# EAGLE design RS232 rev4 (EAGLE 7.3.0)
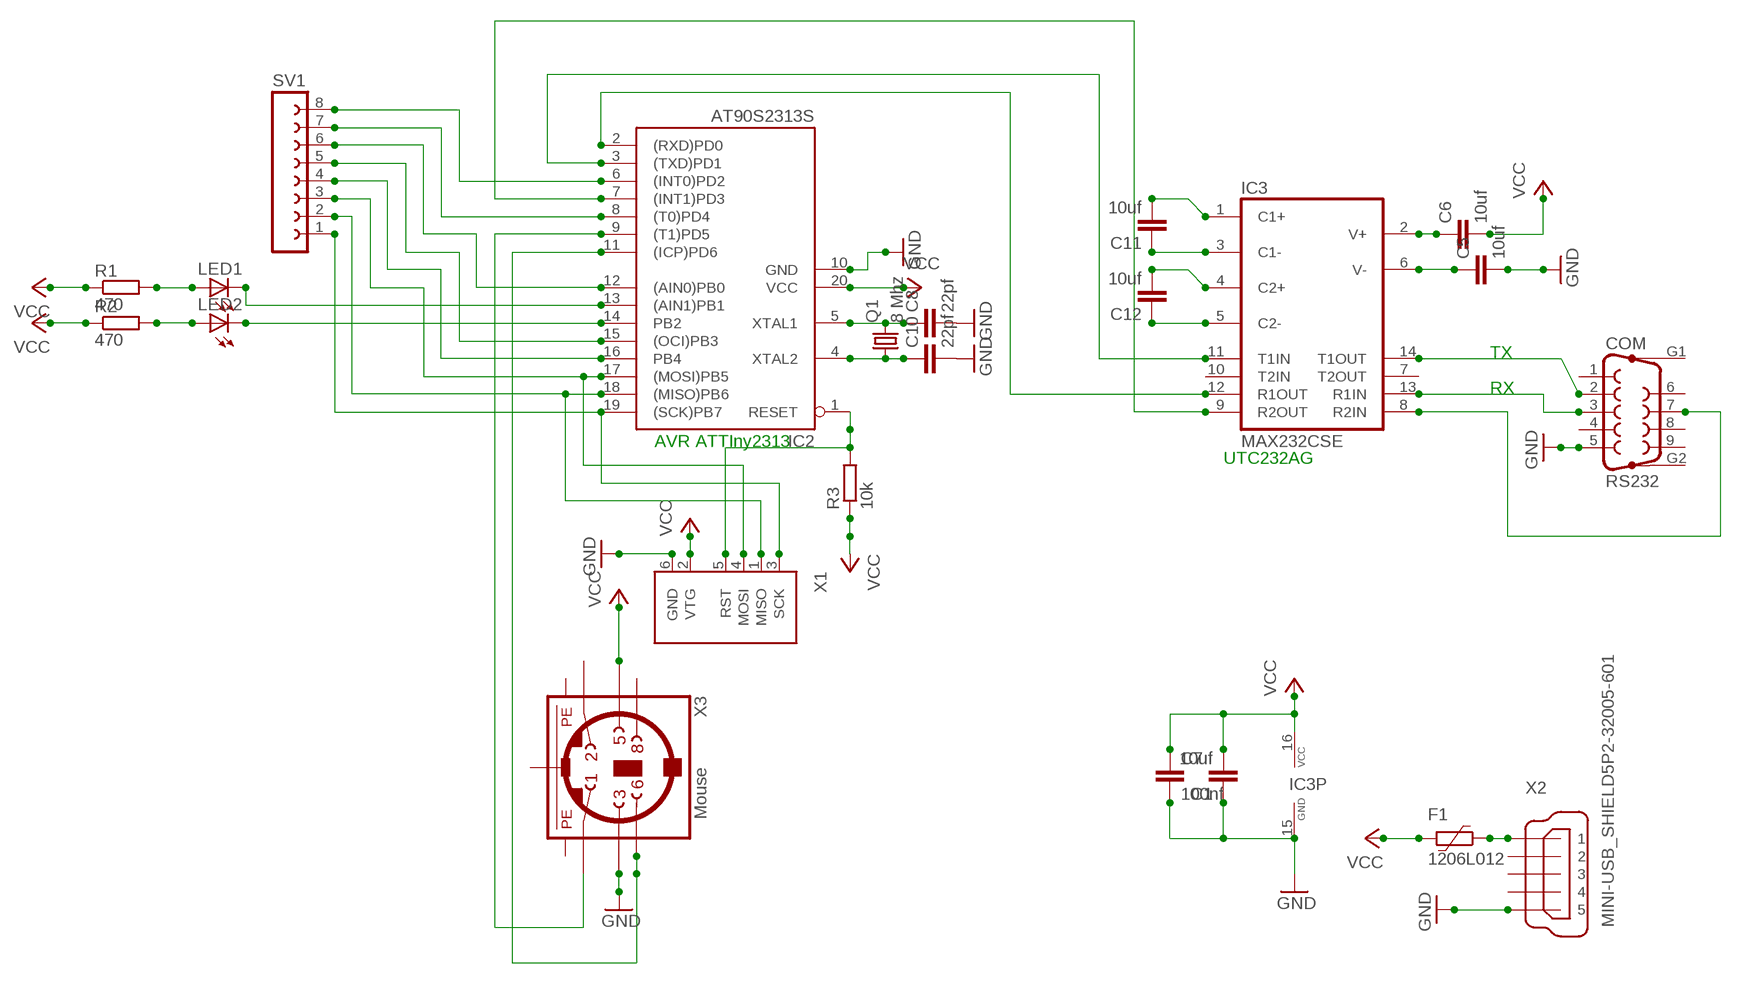
[diagram p0: schematic, sheet 1]

## Parts
C1  10uf  C-EUC1206K  [C1206K]
C5  10uf  C-EUC1206K  [C1206K]
C6  10uf  C-EUC1206K  [C1206K]
C7  100nf  C-EUC1206  [C1206]
C8  22pf  C-EUC1206  [C1206]
C10  22pf  C-EUC1206  [C1206]
C11  10uf  C-EUC1206K  [C1206K]
C12  10uf  C-EUC1206K  [C1206K]
COM  RS232  F09HP  [F09HP]
F1  1206L012  [1206L]
IC2  AT90S2313S  [SO20L]
IC3  MAX232CSE  [SO16]
LED1  LEDCHIPLED_0805  [CHIPLED_0805]
LED2  LEDCHIPLED_0805  [CHIPLED_0805]
Q1  8 Mhz  CRYSTALHC49S  [HC49/S]
R1  470  R-EU_R1206  [R1206]
R2  470  R-EU_R1206  [R1206]
R3  10k  R-EU_R1206  [R1206]
SV1  FE08-1  [FE08]
X1  AVRISP6PINHEADER  [6PINHEADER]
X2  MINI-USB_SHIELD5P2-32005-601  [32005-601]
X3  Mouse  MINI_DIN_6  [M_DIN6]

## Nets
GND: C1.1 C5.2 C7.2 C8.2 C10.2 COM.5 IC2.10(GND) IC3.15(GND) X1.6(GND) X2.5 X3.3
N$1: IC2.3((TXD)PD1) IC3.11(T1IN)
N$2: IC2.2((RXD)PD0) IC3.12(R1OUT)
N$3: C11.1 IC3.3(C1-)
N$4: C11.2 IC3.1(C1+)
N$5: C12.2 IC3.4(C2+)
N$6: C12.1 IC3.5(C2-)
N$7: IC2.1(RESET) R3.2 X1.5(RST)
N$8: IC2.11((ICP)PD6) X3.6
N$9: COM.2 IC3.14(T1OUT)
N$11: IC2.7((INT1)PD3) IC3.9(R2OUT)
N$12: C8.1 IC2.5(XTAL1) Q1.2
N$13: IC2.14(PB2) LED2.C
N$14: C5.1 IC3.6(V-)
N$15: C6.1 IC3.2(V+)
N$16: IC2.13((AIN1)PB1) LED1.C
N$17: COM.3 IC3.13(R1IN)
N$18: C10.1 IC2.4(XTAL2) Q1.1
N$20: LED2.A R2.2
N$21: LED1.A R1.2
N$22: IC2.9((T1)PD5) X3.1
N$26 [VCC]: F1.1 X2.1
PB2: IC2.12((AIN0)PB0) SV1.6
PB3: IC2.15((OCI)PB3) SV1.5
PB4: IC2.16(PB4) SV1.4
PB5: IC2.17((MOSI)PB5) SV1.3 X1.4(MOSI)
PB6: IC2.18((MISO)PB6) SV1.2 X1.1(MISO)
PB7: IC2.19((SCK)PB7) SV1.1 X1.3(SCK)
PD2: IC2.6((INT0)PD2) SV1.8
PD4: IC2.8((T0)PD4) SV1.7
SERIAL#: COM.7 IC3.8(R2IN)
VCC [VCC]: C1.2 C6.2 C7.1 F1.2 IC2.20(VCC) IC3.16(VCC) R1.1 R2.1 R3.1 X1.2(VTG) X3.5
Unconnected: COM.1 COM.4 COM.6 COM.8 COM.9 COM.G1 COM.G2 IC3.7(T2OUT) IC3.10(T2IN) X2.2 X2.3 X2.4 X2.M1(S1) X2.M2(S2) X3.2 X3.8

## Notes on the sheet
- TX
- RX
- AVR ATTIny2313
- UTC232AG

## Power pins joined to a net without a drawn wire
PE1: X3.SH1(PE1)
PE2: X3.SH2(PE2)
PE3: X3.SH3(PE3)

## Library data of the parts
C1 C5-C8 C10-C12 = rcl:C-EU: CAPACITOR, European symbol
COM = con-subd:F09HP: SUB-D; OC_FARNELL: unknown; OC_NEWARK: unknown
F1 = polyfuse-smd_10:?: Polyfuse Resettable PTC Source: http://www.littelfuse.com/products/resettable-ptcs.aspx; MF: Littelfuse; MPN: 1206L012; OC_FARNELL: 1596988; OC_NEWARK: 05M2298
IC2 = atmel:AT90S2313: MICROCONTROLLER 2 Kbytes FLASH 128 bytes SRAM 128 bytes EEPROM UART; OC_FARNELL: unknown; OC_NEWARK: unknown
IC3 = maxim-8:MAX232*: RS232 TRANSEIVER
LED1 LED2 = led:LED: LED OSRAM: - CHIPLED LG R971, LG N971, LY N971, LG Q971, LY Q971, LO R971, LY R971 LH N974, LH R974 LS Q976, LO Q976, LY Q976 LO Q996 - Hyper CHIPLED LW Q18S LB Q993, LB Q99A, LB R99A - SideLED LS A670, LO A670, LY A670, LG A670, LP A670 LB A673, LV A673, LT A673, LW A673 LH A674 LY A675 LS A676, LA A676, LO A676, LY A676, LW A676 LS A679, LY A679, LG A679 - Hyper Micro SIDELED® LS Y876, LA Y876, LO Y876, LY Y876 LT Y87S - SmartLED LW L88C, LW L88S LB L89C, LB L89S, LG L890 LS L89K, LO L89K, LY L89K LS L896, LA L896, LO L896, LY L896 - TOPLED LS T670, LO T670, LY T670, LG T670, LP T670 LSG T670, LSP T670, LSY T670, LOP T670, LYG T670 LG T671, LOG T671, LSG T671 LB T673, LV T673, LT T673, LW T673 LH T674 LS T676, LA T676, LO T676, LY T676, LB T676, LH T676, LSB T676, LW T676 LB T67C, LV T67C, LT T67C, LS T67K, LO T67K, LY T67K, LW E67C LS E67B, LA E67B, LO E67B, LY E67B, LB E67C, LV E67C, LT E67C LW T67C LS T679, LY T679, LG T679 LS T770, LO T770, LY T770, LG T770, LP T770 LB T773, LV T773, LT T773, LW T773 LH T774 LS E675, LA E675, LY E675, LS T675 LS T776, LA T776, LO T776, LY T776, LB T776 LHGB T686 LT T68C, LB T68C - Hyper Mini TOPLED® LB M676 - Mini TOPLED Santana® LG M470 LS M47K, LO M47K, LY M47K Source: http://www.osram.convergy.de LUXEON: - LUMILED® LXK2-PW12-R00, LXK2-PW12-S00, LXK2-PW14-U00, LXK2-PW14-V00 LXK2-PM12-R00, LXK2-PM12-S00, LXK2-PM14-U00 LXK2-PE12-Q00, LXK2-PE12-R00, LXK2-PE12-S00, LXK2-PE14-T00, LXK2-PE14-U00 LXK2-PB12-K00, LXK2-PB12-L00, LXK2-PB12-M00, LXK2-PB14-N00, LXK2-PB14-P00, LXK2-PB14-Q00 LXK2-PR12-L00, LXK2-PR12-M00, LXK2-PR14-Q00, LXK2-PR14-R00 LXK2-PD12-Q00, LXK2-PD12-R00, LXK2-PD12-S00 LXK2-PH12-R00, LXK2-PH12-S00 LXK2-PL12-P00, LXK2-PL12-Q00, LXK2-PL12-R00 Source: www.luxeon.com KINGBRIGHT: KA-3528ASYC Source: www.kingbright.com
Q1 = crystal:CRYSTAL: CRYSTAL; OC_FARNELL: 1667008; OC_NEWARK: unknown
R1-R3 = rcl:R-EU_: RESISTOR, European symbol
SV1 = con-lsta:FE08-1: FEMALE HEADER; OC_FARNELL: unknown; OC_NEWARK: unknown
X1 = avrisp:AVRISP6PIN
X2 = con-cypressindustries:MINI-USB_SHIELD5P2-: MINI USB-B R/A DIP 5pol. Source: www.cypressindustries.com; OC_FARNELL: unknown; OC_NEWARK: unknown
X3 = mini_din:MINI_DIN_6

## Net classes
1 VCC: width 0.006 mm

## Board
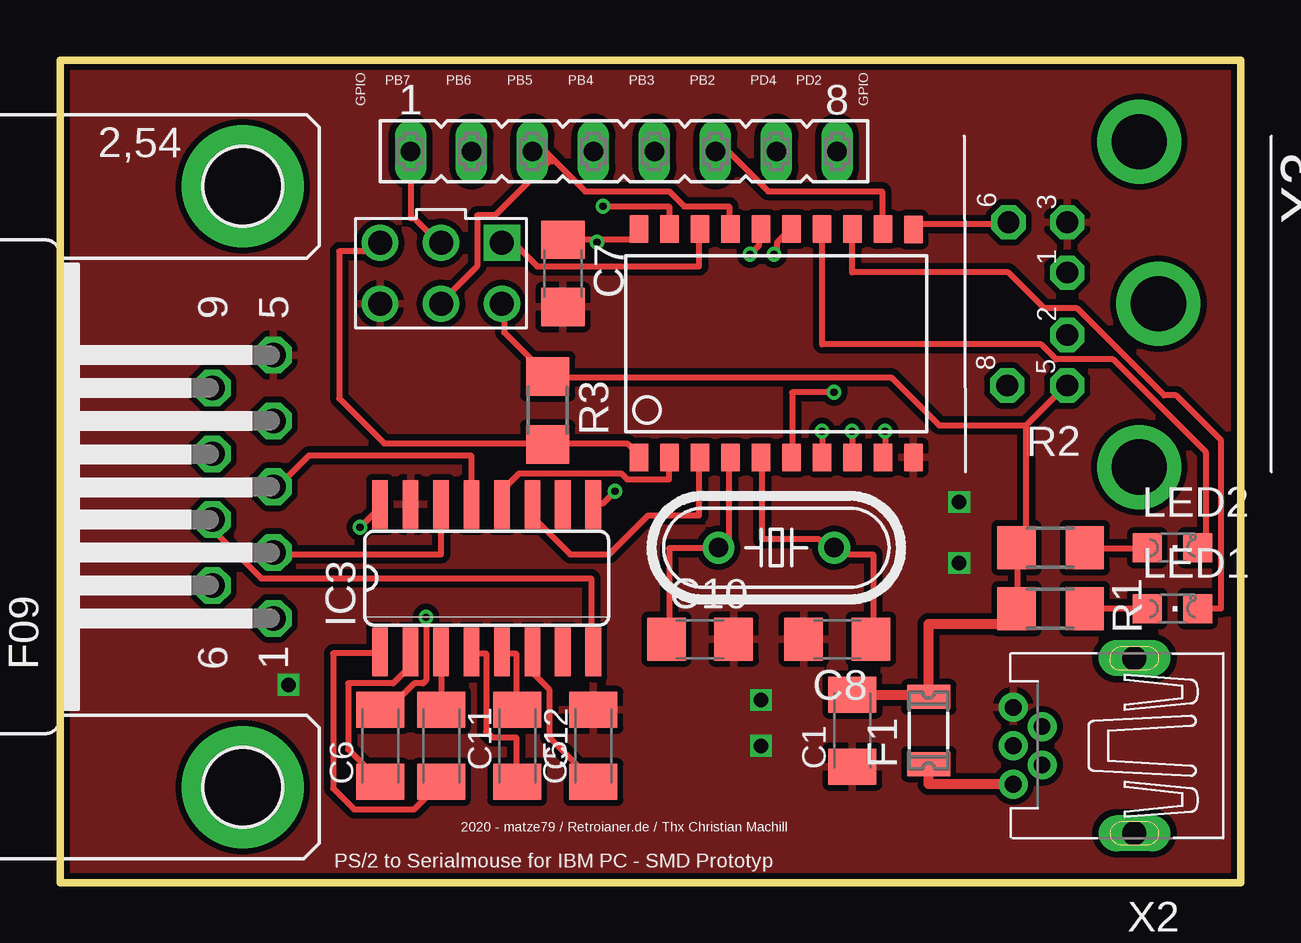
[diagram p1: board, top side]
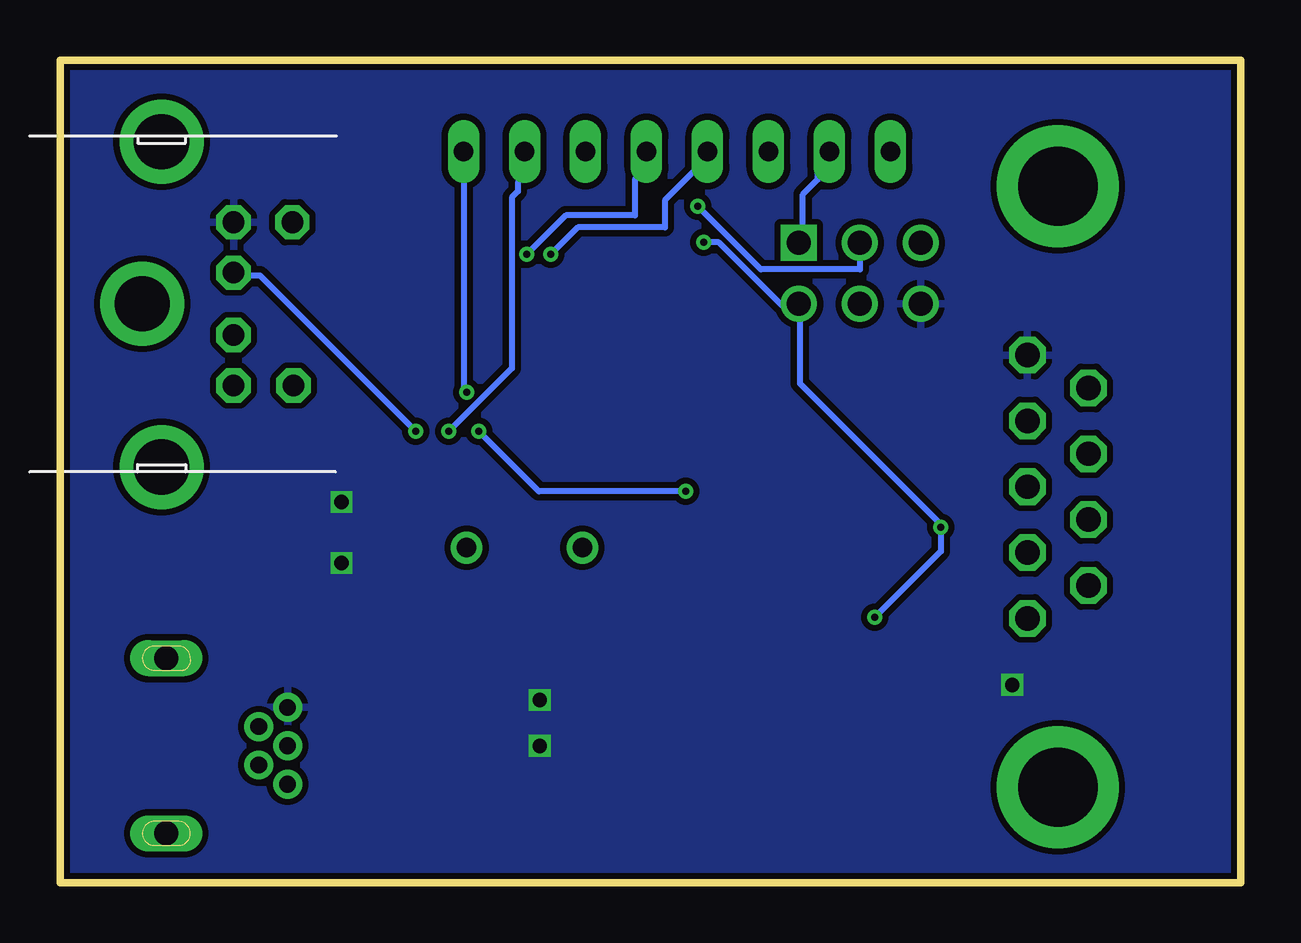
[diagram p2: board, bottom side, seen from below]

Size 49.2 x 34.29 mm. Coordinates in mm from the lower left corner, seen from the top.
Outline: 0,0 49.2,0 49.2,34.29 0,34.29 0,0
Copper layers (1*16): Top 0.035mm / dielectric 1.5mm / Bottom 0.035mm
Design rules "dirt_cheap_dirty_boards.v1.1 *": minimum track width 10mil, minimum drill 12mil, track to track 6mil, track to pad 6mil, pad to pad 6mil, via to via 6mil, smd to smd 0mil, copper to edge 10mil, drill to drill 10mil, minimum pad ring 10mil, minimum via ring 6mil, stop-mask expansion 2mil, vias tented up to drill 25mil, thermal gap 10mil

### Footprints (pad centres in the part's own frame; a part is rotated, then mirrored left to right if it is on the bottom)
C1206K = smd 1.5 x 2: 1 -1.5,0; 2 1.5,0
C1206 = smd 1.6 x 1.8: 1 -1.4,0; 2 1.4,0
F09HP = drill 1.016 octagon: 1 -5.486,-1.27; 2 -2.743,-1.27; 3 0,-1.27; 4 2.743,-1.27; 5 5.486,-1.27; 6 -4.115,1.27; 7 -1.372,1.27; 8 1.372,1.27; 9 4.115,1.27 | drill 3.302 pad 5.08: G1 -12.522,0; G2 12.522,0
1206L = smd 1 x 1.8: 1 -1.4,0; 2 1.4,0
SO20L = smd 0.762 x 1.143: 1 -5.08,-5.131; 2 -3.81,-5.131; 3 -2.54,-5.131; 4 -1.27,-5.131; 5 0,-5.131; 6 1.27,-5.131; 7 2.54,-5.131; 8 3.81,-5.131; 9 5.08,-5.131; 10 6.35,-5.131; 11 6.35,4.369; 12 5.08,4.394; 13 3.81,4.394; 14 2.54,4.394; 15 1.27,4.394; 16 0,4.394; 17 -1.27,4.394; 18 -2.54,4.394; 19 -3.81,4.394; 20 -5.08,4.394
SO16 = smd 0.66 x 2.032: 1 -4.445,-3.073; 2 -3.175,-3.073; 3 -1.905,-3.073; 4 -0.635,-3.073; 5 0.635,-3.073; 6 1.905,-3.073; 7 3.175,-3.073; 8 4.445,-3.073; 9 4.445,3.073; 10 3.175,3.073; 11 1.905,3.073; 12 0.635,3.073; 13 -0.635,3.073; 14 -1.905,3.073; 15 -3.175,3.073; 16 -4.445,3.073
CHIPLED_0805 = smd 1.2 x 1.2: A 0,-1.05; C 0,1.05
HC49/S = drill 0.813: 1 -2.413,0; 2 2.413,0
R1206 = smd 1.6 x 1.803: 1 -1.422,0; 2 1.422,0
FE08 = drill 0.813 long: 1 -8.89,0; 2 -6.35,0; 3 -3.81,0; 4 -1.27,0; 5 1.27,0; 6 3.81,0; 7 6.35,0; 8 8.89,0
6PINHEADER = drill 1 square: 1 -1.27,2.54 | drill 1: 2 1.27,2.54; 3 -1.27,0; 4 1.27,0; 5 -1.27,-2.54; 6 1.27,-2.54
32005-601 = drill 0.7 pad 1.016: 1 2.825,1.6; 2 1.625,0.8; 3 2.825,0; 4 1.625,-0.8; 5 2.825,-1.6 | drill 1 pad 1.422 long: M1 -2.225,3.65; M2 -2.225,-3.65
M_DIN6 = drill 0.9 pad 1.422 octagon: 1 -1.3,-3.75; 2 1.3,-3.75; 3 -3.4,-3.75; 5 3.4,-3.75; 6 -3.4,-6.2; 8 3.4,-6.25 | drill 2.3 pad 3.5: SH1 6.8,-0.75; SH2 0,0.05; SH3 -6.75,-0.75

### Placement (x,y rotation side)
C1  33.02,6.35 90 top
C5  22.23,5.71 90 top
C6  13.34,5.71 90 top
C7  20.95,25.4 270 top
C8  32.38,10.16 180 top
C10  26.67,10.16 0 top
C11  15.88,5.71 270 top
C12  19.05,5.71 270 top
COM  7.62,16.51 90 top
F1  36.2,6.35 90 top
IC2  29.21,22.86 0 top
IC3  17.78,12.7 0 top
LED1  46.35,11.43 270 top
LED2  46.35,13.97 270 top
Q1  29.84,13.97 0 top
R1  41.27,11.43 0 top
R2  41.27,13.97 0 top
R3  20.32,19.68 270 top
SV1  23.5,30.48 0 top
X1  15.88,25.4 270 top
X2  42.55,5.71 180 top
X3  45.72,24.13 270 top

### Tracks (layer width: path | path; a pad name or v marks a point on that pad's centre or on a via)
GND  (via drill 0.6)
  other vias: 9.53,8.25 29.21,7.62 29.21,5.71 37.47,13.34 37.47,15.88
  pour Bottom (isolate 0.254): 0,34.29 48.9,34.29 48.9,0 0,0
  pour Top (isolate 0.254): 0,34.29 0,0 48.9,0 48.9,34.29
N$1
  Top 0.254: IC2.3 26.62,17.7 26.62,15.32 24.5,15.32 22.88,13.7 21.25,13.7 19.75,15.2 19.75,15.7 IC3.11
N$2
  Top 0.254: IC2.2 25.38,17.7 25.38,16.82 23.62,16.82 23.38,17.07 19.12,17.07 18.5,16.45 18.5,15.82 IC3.12
N$3
  Top 0.254: IC3.3 C11.1
N$4
  Top 0.254: C11.2 15.88,4.2 14.75,3.07 12.25,3.07 11.38,3.95 11.38,9.57 13.25,9.57 IC3.1
N$5
  Top 0.254: C12.2 19,4.32 19,6.07 18,6.07 17.75,6.32 17.75,9.57 17.25,9.57 IC3.4
N$6
  Top 0.254: C12.1 19,7.32 19,9.57 18.5,9.57 IC3.5
N$7
  Top 0.254: IC2.1 24.12,17.82 23.62,18.32 20.38,18.32 R3.2 20.25,18.32 13.5,18.32 11.62,20.2 11.62,26.32 12.62,26.32 12.88,26.57 13.25,26.57 X1.5
N$8
  Top 0.254: IC2.11 35.62,27.32 35.75,27.45 39.5,27.45 X3.6
N$9
  Top 0.254: IC3.14 15.88,13.7 9,13.7 COM.2
N$11  (via drill 0.3)
  Top 0.254: v31.75,18.82 IC2.7 | v23.12,16.32 22.62,15.82 22.25,15.82 IC3.9
  Bottom 0.254: v31.75,18.82 29.25,16.32 v23.12,16.32
N$12
  Top 0.254: IC2.5 29.25,17.7 29.25,14.32 31.62,14.32 32,13.95 32.25,13.95 Q1.2 32.38,13.95 32.62,13.95 32.88,13.7 33.88,13.7 33.88,10.2 C8.1
N$13
  Top 0.254: IC2.14 31.75,22.45 40.88,22.45 41.5,21.82 43.88,21.82 47.75,17.95 47.75,14.07 47.5,14.07 LED2.C
N$14
  Top 0.254: C5.1 22.12,4.32 20.38,6.07 20.38,8.07 19.75,8.7 19.75,9.57 IC3.6
N$15
  Top 0.254: C6.1 13.25,4.32 12,5.57 12,8.32 13.88,8.32 14.5,8.95 14.5,9.57 IC3.2
N$16
  Top 0.254: IC2.13 33,27.2 33,25.45 39.5,25.45 41,23.95 42.38,23.95 46,20.32 46.5,20.32 48.38,18.45 48.38,11.45 47.5,11.45 LED1.C
N$17
  Top 0.254: IC3.13 17.12,15.82 17.12,17.82 10.38,17.82 9.12,16.57 9,16.57 COM.3
N$18
  Top 0.254: IC2.4 27.88,17.7 27.88,14.07 27.5,14.07 Q1.1 27.38,13.95 25.38,13.95 25.38,10.2 C10.1
N$20
  Top 0.254: LED2.A 45.25,13.95 42.75,13.95 R2.2
N$21
  Top 0.254: LED1.A 45.25,11.45 42.75,11.45 R1.2
N$22  (via drill 0.3)
  Top 0.254: v34.38,18.82 34.38,17.82 IC2.9
  Bottom 0.254: v34.38,18.82 40.88,25.32 41.88,25.32 X3.1
N$26
  Top 0.406: X2.1 36.2,4.12 F1.1
PB2
  Top 0.254: IC2.12 34.25,27.32 34.25,28.82 29.5,28.82 27.88,30.45 27.38,30.45 SV1.6
PB3  (via drill 0.3)
  Top 0.254: v29.75,26.2 29.88,26.2 29.88,26.7 30.38,27.2 IC2.15
  Bottom 0.254: v29.75,26.2 28.12,27.82 25.25,27.82 25.25,29.32 24.88,29.7 24.88,30.45 SV1.5
PB4  (via drill 0.3)
  Top 0.254: v28.75,26.2 29.12,26.57 29.12,27.2 IC2.16
  Bottom 0.254: v28.75,26.2 27.62,27.32 24,27.32 24,28.45 22.25,30.2 22.25,30.45 SV1.4
PB5
  Top 0.254: 20.56,30.13 20.25,30.45 19.75,30.45 SV1.3 | 20.56,30.13 21.88,28.82 25.38,28.82 26,28.2 27.88,28.2 27.88,27.32 IC2.17 | X1.4 15.88,24.2 17.38,25.7 17.38,27.82 18.12,27.82 20.38,30.07 20.5,30.07 20.56,30.13
PB6
  Top 0.254: IC2.18 26.62,27.2 26.62,25.7 19.88,25.7 19,26.57 18.5,26.57 X1.1
  Bottom 0.254: SV1.2 17.25,30.45 17.62,30.07 17.62,29.32 18.25,28.7 18.25,26.82 18.38,26.7 X1.1
PB7  (via drill 0.3)
  Top 0.254: v22.62,28.2 25.38,28.2 25.38,27.32 IC2.19 | SV1.1 14.62,30.45 14.62,27.7 14.75,27.7 15.75,26.7 15.88,26.7 X1.3
  Bottom 0.254: v22.62,28.2 20,25.57 15.88,25.57 X1.3
PD2  (via drill 0.3)
  Top 0.254: v32.25,20.45 30.5,20.45 30.5,17.82 IC2.6
  Bottom 0.254: v32.25,20.45 32.38,20.57 32.38,30.45 SV1.8
PD4  (via drill 0.3)
  Top 0.254: v33,18.82 33,17.82 IC2.8
  Bottom 0.254: v33,18.82 30.38,21.45 30.38,28.57 30.12,28.82 30.12,29.2 29.88,29.45 29.88,30.45 SV1.7
SERIAL#
  Top 0.254: IC3.8 22.12,9.7 22.12,12.7 8.38,12.7 6.38,14.7 6.38,15.07 COM.7
VCC  (via drill 0.3)
  Top 0.254: R1.1 39.88,11.45 39.88,13.95 R2.1 39.88,14.07 40.25,14.07 40.25,19.07 | 40.25,19.07 41.88,20.7 X3.5 | v15.25,11.07 15.25,8.45 15.12,8.32 14.75,8.32 14.25,7.82 13.88,7.82 13.38,7.32 C6.2 | v12.5,14.82 13.38,15.7 IC3.16 | 22.38,26.82 21,26.82 C7.1 | 22.38,26.82 23.75,26.82 24.12,27.2 IC2.20 | X1.2 18.5,24.07 18.5,22.95 20.25,21.2 R3.1 20.38,21.07 34.62,21.07 36.62,19.07 40.25,19.07 | v22.38,26.7 22.38,26.82
  Top 0.406: R1.1 39.85,10.8 36.2,10.8 F1.2 36.83,7.85 C1.2
  Bottom 0.254: v15.25,11.07 12.5,13.82 v12.5,14.82 12.5,14.95 18.38,20.82 18.38,24.07 X1.2 18.5,24.07 19.12,24.07 21.75,26.7 v22.38,26.7

### Text on the board
tNames: PB7 | PB6 | PB5 | PB4 | PB3 | PB2 | PD4 | PD2 | GPIO | GPIO | 2020 - matze79 / Retroianer.de / Thx Christian Machill | PS/2 to Serialmouse for IBM PC - SMD Prototyp